# EasyEDA Pro project reference-carrier.epro, board ESP32S3开发板
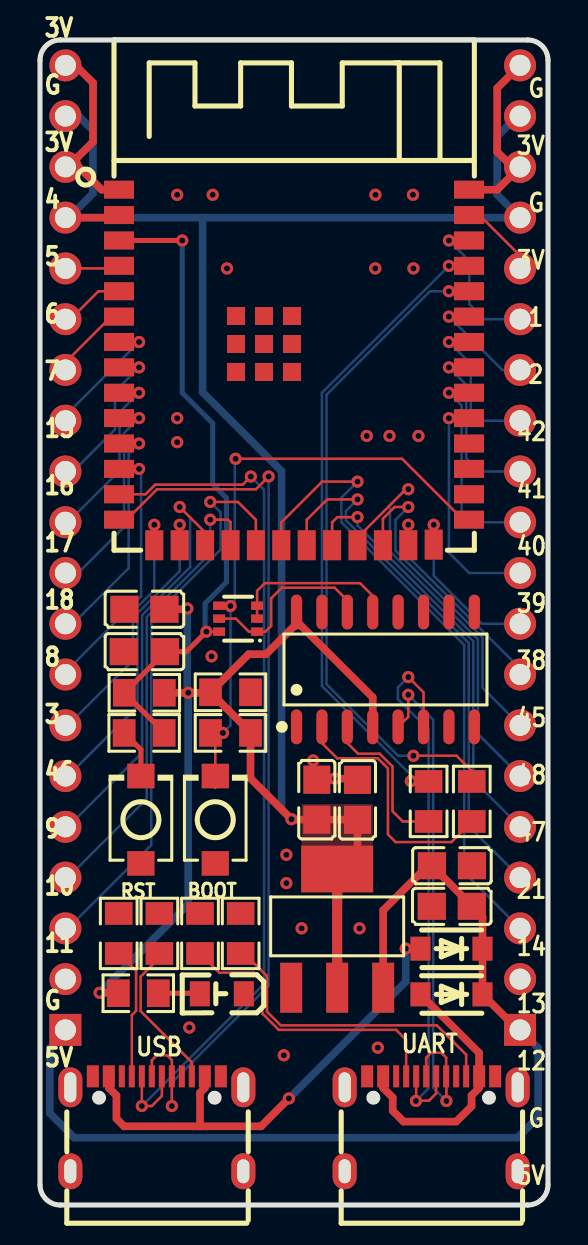
[diagram p2: board, top side]
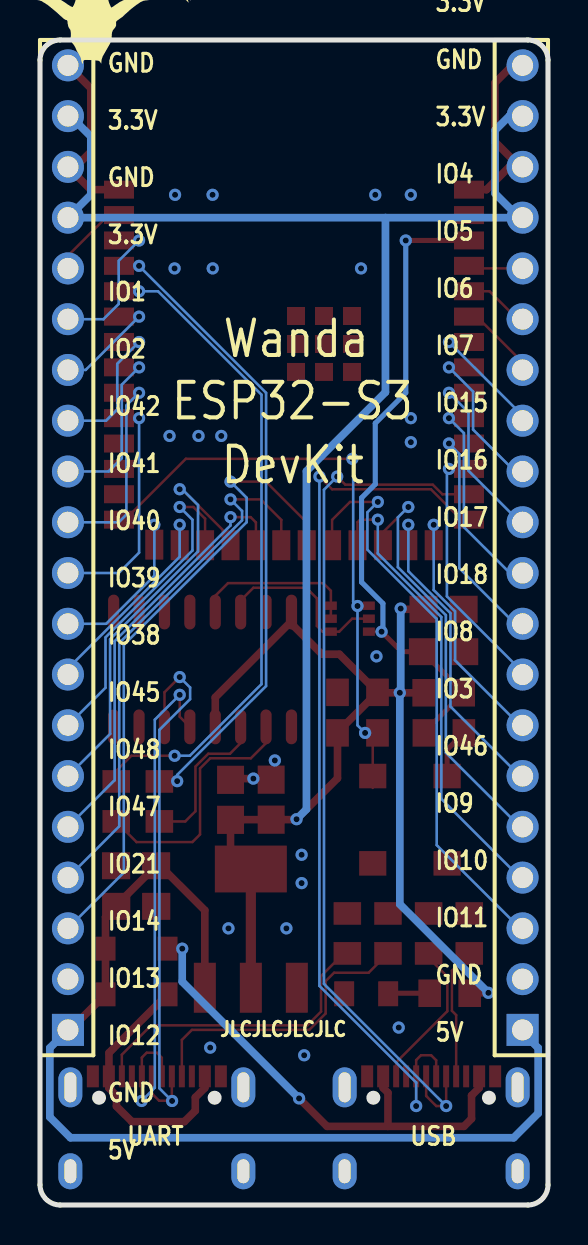
[diagram p3: board, bottom side, seen from below]

Outline 25.4 x 58.29 mm; copper layers: Top Layer, Bottom Layer. Coordinates in mm from the lower left corner of the outline.
Outline path: 0,57.28 0,1.02 arc(0.3,0.3) 1.02,0 24.38,0 arc(25.1,0.3) 25.4,1.02 25.4,57.28 arc(25.1,58) 24.38,58.29 1.02,58.29 arc(0.3,58) 0,57.28
Stack: Top Layer 0.035mm / Dielectric1 1.51mm FR4 er 4.5 / Bottom Layer 0.035mm

## Design rules (mm)
spacing copperThickness1oz (default): track to track 0.102, other pairs 0.152 to 0.3
spacing copperThickness2oz: track to track 0.203, other pairs 0.152 to 0.3
spacing Plane_innerPlane: track to track 0.102, other pairs 0.152 to 0.3
spacing Copper_copperRegion: track to track 0.102, other pairs 0.152 to 0.3
track width copperThickness1oz (default): min 0.127, default 0.254, max 2.54
track width copperThickness2oz: min 0.203, default 0.254, max 2.54
track width 电源: min 0.381, default 0.508, max 2.54
differential pair differentialPair (default): width min 0.127, default 0.254, max 2.54; gap min 0.152, default 0.152
net GND uses 电源
net V3.3 uses 电源
net VBUS uses 电源
pour e481 uses Copper_copperRegion
pour e588 uses Copper_copperRegion

## Placement (name value [footprint] x y rotation side)
BOOT  GT-TC029B-H025-L1N  [SW-SMD_L3.9-W3.0-P4.45]  8.76 19.28 90 top
C1  1uF  [C0805#2]  5.22 27.69 180 top
C3  10uF  [C0805]  20.59 14.94 0 top
C4  100nF  [C0805]  20.6 16.98 180 top
C5  10uF  [C0805]  15.87 20.27 270 top
C6  100nF  [C0805]  13.84 20.28 270 top
C7  100nF  [C0805]  5.22 29.81 180 top
D1  SS14L  [SOD-123F_L2.8-W1.8-LS3.7-RD]  20.57 12.83 180 top
D2  SS14L  [SOD-123F_L2.8-W1.8-LS3.7-RD]  20.57 10.54 180 top
H3  KH-2.54PH180-1X20P-L11.5  [HDR-TH_20P-P2.54-V-M]  1.27 32.89 90 bottom
H4  KH-2.54PH180-1X20P-L11.5  [HDR-TH_20P-P2.54-V-M]  24 32.89 90 bottom
LED1  NCD0805R1  [LED0805-RD_RED]  9.09 10.57 180 top
Q1  UMH3N  [SC-70-6_L2.2-W1.3-P0.65-LS2.1-BR]  9.91 29.34 0 top
R1  5.1kΩ  [R0805]  5.97 13.59 90 top
R2  10K  [R0805]  5.22 25.63 180 top
R3  10K  [R0805]  9.53 23.62 0 top
R5  200Ω  [R0805]  5.21 23.62 0 top
R6  5.1kΩ  [R0805]  3.94 13.59 90 top
R18  10K  [R0805]  9.53 25.65 180 top
R19  5.1kΩ  [R0805]  10.03 13.59 90 top
R20  5.1kΩ  [R0805]  8 13.59 90 top
R21  1kΩ  [R0805]  4.91 10.6 0 top
R22  200Ω  [R0805]  21.59 20.19 90 top
R23  200Ω  [R0805]  19.43 20.19 90 top
RST  GT-TC029B-H025-L1N  [SW-SMD_L3.9-W3.0-P4.45]  5.04 19.28 90 top
U1  ESP32-S3-WROOM-1-N16R8  [WIRELM-SMD_ESP32-S3-WROOM-1]  12.7 41.91 0 top
U3  AMS1117-3.3  [SOT-223-3_L6.5-W3.4-P2.30-LS7.0-BR]  14.86 13.84 270 top
U4  CH340C  [SOP-16_L10.0-W3.9-P1.27-LS6.0-BL]  17.27 26.8 0 top
USB1  TYPE-C 16PIN 2MD(073)  [USB-C-SMD_TYPE-C-6PIN-2MD-073]  5.84 4.06 0 top
USB2  TYPE-C 16PIN 2MD(073)  [USB-C-SMD_TYPE-C-6PIN-2MD-073]  19.56 4.06 0 top

## Footprints (pads in the part's own frame, mm; a bottom-side part is the same pattern mirrored in y, then rotated)
C0805
  rect 1.41x1.35 smd: 1(-1,0) 2(1,0)
C0805#2
  rect 1.41x1.35 smd: 1(-1.03,0) 2(1.03,0)
HDR-TH_20P-P2.54-V-M
  rect 1.6x1.6 hole 1.05: 1(-24.13,0)
  round 1.6 hole 1.05: 2(-21.59,0) 3(-19.05,0) 4(-16.51,0) 5(-13.97,0) 6(-11.43,0) 7(-8.89,0) 8(-6.35,0) 9(-3.81,0) 10(-1.27,0) 11(1.27,0) 12(3.81,0) 13(6.35,0) 14(8.89,0) 15(11.43,0) 16(13.97,0) 17(16.51,0) 18(19.05,0) 19(21.59,0) 20(24.13,0)
LED0805-RD_RED
  rect 1x1.25 smd: 1(-1.1,0) 2(1.1,0)
R0805
  rect 1.133x1.377 smd: 1(-1,0) 2(1,0)
SC-70-6_L2.2-W1.3-P0.65-LS2.1-BR
  rect 0.6x0.42 smd: 1(0.95,-0.65) 2(0.95,0) 3(0.95,0.65) 4(-0.95,0.65) 5(-0.95,0) 6(-0.95,-0.65)
SOD-123F_L2.8-W1.8-LS3.7-RD
  rect 1x1.2 smd: 1(-1.55,0) 2(1.55,0)
SOP-16_L10.0-W3.9-P1.27-LS6.0-BL
  oval 0.56x1.745 smd: 1(-4.445,-2.873) 2(-3.175,-2.873) 3(-1.905,-2.873) 4(-0.635,-2.873) 5(0.635,-2.873) 6(1.905,-2.873) 7(3.175,-2.873) 8(4.445,-2.873) 9(4.445,2.873) 10(3.175,2.873) 11(1.905,2.873) 12(0.635,2.873) 13(-0.635,2.873) 14(-1.905,2.873) 15(-3.175,2.873) 16(-4.445,2.873)
SOT-223-3_L6.5-W3.4-P2.30-LS7.0-BR
  rect 2.5x1.1 smd: 1(2.97,-2.3) 2(2.97,0) 3(2.97,2.3)
  rect 2.34x3.6 smd: 4(-2.97,0)
SW-SMD_L3.9-W3.0-P4.45
  rect 1.23x1.36 smd: 1(-2.185,0) 2(2.185,0)
USB-C-SMD_TYPE-C-6PIN-2MD-073
  rect 0.6x1.1 smd: 1(-3.2,2.375) 2(-2.4,2.375) 11(2.4,2.375) 12(3.2,2.375)
  rect 0.3x1.1 smd: 3(-1.75,2.375) 4(-1.25,2.375) 5(-0.75,2.375) 6(-0.25,2.375) 7(0.25,2.375) 8(0.75,2.375) 9(1.25,2.375) 10(1.75,2.375)
  oval 1.2x2 hole 0.6x1.5: 13(-4.325,1.825) 14(4.325,1.825)
  oval 1.2x1.8 hole 0.6x1.2: 13(-4.325,-2.375) 14(4.325,-2.375)
WIRELM-SMD_ESP32-S3-WROOM-1
  rect 1.5x0.9 smd: 1(-8.75,8.895) 2(-8.75,7.625) 3(-8.75,6.355) 4(-8.75,5.085) 5(-8.75,3.815) 6(-8.75,2.545) 7(-8.75,1.275) 8(-8.75,0.005) 9(-8.75,-1.265) 10(-8.75,-2.535) 11(-8.75,-3.805) 12(-8.75,-5.075) 13(-8.75,-6.345) 14(-8.75,-7.615) 27(8.75,-7.615) 28(8.75,-6.345) 29(8.75,-5.075) 30(8.75,-3.805) 31(8.75,-2.535) 32(8.75,-1.265) 33(8.75,0.005) 34(8.75,1.275) 35(8.75,2.545) 36(8.75,3.815) 37(8.75,5.085) 38(8.75,6.355) 39(8.75,7.625) 40(8.75,8.895)
  rect 0.9x1.5 smd: 15(-6.985,-8.895) 16(-5.715,-8.895) 17(-4.445,-8.895) 18(-3.175,-8.895) 19(-1.905,-8.895) 20(-0.635,-8.895) 21(0.635,-8.895) 22(1.905,-8.895) 23(3.175,-8.895) 24(4.445,-8.895) 25(5.715,-8.895) 26(6.985,-8.865)
  rect 0.9x0.9 smd: 41(-2.9,2.575) 41(-2.9,1.175) 41(-2.9,-0.225) 41(-1.5,2.575) 41(-1.5,1.175) 41(-1.5,-0.225) 41(-0.1,2.575) 41(-0.1,1.175) 41(-0.1,-0.225)

## Nets
As in the schematic, except:
GND: BOOT.1 C1.2 C3.1 C4.1 C5.1 C6.1 C7.2 H3.2 H3.18 H3.20 H4.2 H4.18 H4.20 LED1.1 R1.2 R6.2 R18.1 R19.2 R20.2 RST.1 U1.1 U1.40 U1.41 U3.1 U4.1 USB1.1 USB1.12 USB1.13 USB1.14 USB2.1 USB2.12 USB2.13 USB2.14
IO0: BOOT.2 Q1.4 R3.1 U1.27
$1N3591: R5.1 RST.2

Pads without a net: U1 28 29 30; U4 7 8 9 10 11 12 15; USB1 3 9; USB2 3 9

## Via types
v1: diameter 0.61, hole 0.305, Top Layer to Bottom Layer, 69 vias

## Routing (per net, layer and track width the routed paths; a pad name or vN(x,y) marks a point on that pad's centre or on a via; arc(x,y) is an arc through that point)
GND: length 20.8
  Top Layer w0.381: C6.1 14.68,21.28 v1(14.73,21.34) 15.81,21.34 C5.1 ; 1.4,57.02 1.78,57.02 2.65,56.15 2.65,53.2 1.4,51.94 1.94,51.94 3.08,50.8 U1.1 ; U1.40 22.86,50.8 H4.18 ; 24.04,51.95 23.61,51.95 22.86,52.7 22.86,55.88 H4.20
  vias: v1(6.86,50.55) v1(6.86,39.37) v1(6.86,38.17) v1(7.46,8.88) v1(8.64,50.55) v1(8.58,27.45) v1(9.35,46.86) v1(12.19,7.49) v1(12.32,17.53) v1(12.32,16.11) v1(13.08,13.84) v1(13.66,22.25) v1(15.98,13.84) v1(16.34,38.48) v1(16.77,50.55) v1(16.76,46.86) v1(16.89,7.87) v1(17.47,38.48) v1(18.65,50.55) v1(18.67,46.86) v1(18.92,38.48)
V3.3: length 128.3
  Top Layer w0.381: U3.4 15.87,17.83 C5.2 15.87,19.28 C6.2 12.72,19.28 12.7,19.3 v1(12.57,19.3) 10.53,21.35 R3.2 10.53,23.65 R18.2 10.43,27.56 11.3,27.56 12.83,29.08 12.83,29.21 ; 8.5,25.63 v1(7.41,25.63) R2.1 ; U1.2 3.82,49.4 1.4,49.4 ; C7.1 7.33,29.81 v1(7.37,29.85) ; U4.4 16.64,25.4 12.83,29.21 ; U4.16 12.83,29.21 ; v1(2.98,10.62) 3.63,10.62 3.67,10.57
  Top Layer w0.508: U3.2 U3.4
  Bottom Layer w0.381: v1(7.37,29.85) 7.37,25.67 v1(7.41,25.63) 7.41,15.05 2.98,10.62 v1(2.98,10.62) ; 1.4,54.48 1.94,54.48 2.65,53.77 2.65,50.61 1.46,49.43 1.46,49.4 ; v1(12.57,19.3) 12.08,19.8 12.08,36.72 8.13,40.67 8.13,49.4 ; H4.19 23.88,54.48 22.86,53.47 22.86,50.55 H4.17 8.13,49.4 ; 1.46,49.4 1.4,49.4 ; 1.46,49.4 8.13,49.4 ; 1.46,49.4 1.43,49.38
VBUS: length 52
  Top Layer w0.381: U3.3 17.16,14.75 19.39,16.98 C4.2 21.59,14.98 C3.2 22.12,14.41 D1.1 D2.1 23.9,8.76 H4.1
  Bottom Layer w0.381: 1.4,8.76 0.49,7.86 0.49,4.59 1.71,3.37 23.88,3.37 24.91,4.4 24.91,7.86 H4.1
D+: length 27.2
  Top Layer w0.127: USB2.6 19.31,7.37 19.56,7.62 20.07,7.62 20.31,7.38 USB2.8 20.32,6.43 v1(20.32,5.21) ; 17.91,23.92 18.41,24.43 v1(18.41,25.53)
  Bottom Layer w0.127: v1(20.32,5.21) 19.66,5.87 19.66,24.28 v1(18.41,25.53)
D-: length 28.4
  Top Layer w0.127: 18.81,5.19 18.83,5.22 19.44,5.22 19.81,5.58 USB2.7 ; 18.81,5.19 v1(18.8,5.21) ; 18.81,5.19 USB2.5 ; v1(18.41,26.42) 19.18,25.65 U4.6
  Bottom Layer w0.127: v1(18.8,5.21) 19.43,5.84 19.43,23.78 17.89,25.31 17.89,25.9 v1(18.41,26.42)
DTR: length 8.4
  Top Layer w0.127: U4.13 16.64,30.48 16,31.12 11.24,31.12 10.86,30.73 Q1.3 Q1.2
EN: length 33
  Top Layer w0.127: Q1.6 v1(8.32,28.69)
  Top Layer w0.254: R5.2 6.21,23.64 R2.2 6.25,27.66 C1.1 7.32,27.69 v1(8.32,28.69) ; 3.95,48.26 v1(7.11,48.26)
  Bottom Layer w0.254: v1(8.32,28.69) 8.25,28.75 8.25,30.1 9.32,31.17 9.32,35.38 8.64,36.07 8.64,39.12 7.11,40.64 v1(7.11,48.26)
IO0: length 30.3
  Top Layer w0.127: v1(9.53,29.97) 9.51,29.99 Q1.4 ; v1(9.78,37.34) 18.1,37.34 21.15,34.29 U1.27 ; R3.1 8.76,23.38 8.76,20.87
  Bottom Layer w0.127: v1(9.15,23.62) 9.53,24 v1(9.53,29.97) 9.74,30.19 9.74,37.3 v1(9.78,37.34)
IO1: length 4
  Top Layer w0.127: H4.16 24,47.5 21.97,49.53 U1.39
IO2: length 7.5
  Top Layer w0.127: 21.45,48.26 v1(20.45,48.26)
  Bottom Layer w0.127: v1(20.45,48.26) 21.46,47.24 21.46,45.09 22.22,44.32 H4.15
IO3: length 12.8
  Top Layer w0.127: 5.72,33.01 v1(5.72,34.04)
  Bottom Layer w0.127: v1(5.72,34.04) 5.72,30.77 4.65,29.71 4.65,27.25 1.4,24
IO4: length 2.6
  Top Layer w0.127: U1.4 3.82,46.86 1.4,46.86
IO5: length 3.1
  Top Layer w0.127: 3.95,45.72 2.92,45.72 1.52,44.32 1.4,44.32
IO6: length 4
  Top Layer w0.127: 1.4,41.78 1.37,41.81 1.37,42.27 3.43,44.32 3.82,44.32 U1.6
IO7: length 6.4
  Top Layer w0.127: 3.95,43.18 v1(4.95,43.18)
  Bottom Layer w0.127: 1.4,39.24 1.52,39.37 1.52,39.75 v1(4.95,43.18)
IO8: length 12.8
  Top Layer w0.127: U1.12 4.95,36.83
  Bottom Layer w0.127: 1.4,26.54 1.4,26.8 5.05,30.45 5.05,36.73 v1(4.95,36.83)
IO9: length 21.2
  Top Layer w0.127: v1(6.99,34.93) 8.25,33.66 U1.17
  Bottom Layer w0.127: v1(6.99,34.93) 7.51,34.4 7.51,31.92 5.11,29.52 5.11,22.63 1.4,18.92
IO10: length 23.1
  Top Layer w0.127: v1(8.51,34.29) 9.4,34.29 9.53,34.16 U1.18
  Bottom Layer w0.127: 1.4,16.38 5.34,20.32 5.34,29.42 8.51,32.6 v1(8.51,34.29)
IO11: length 28.6
  Top Layer w0.127: U1.19 10.79,34.28 9.9,35.18 v1(8.51,35.18)
  Bottom Layer w0.127: v1(8.51,35.18) 9.03,34.66 9.03,32.79 5.56,29.33 5.56,18.01 1.4,13.84
IO12: length 32.2
  Top Layer w0.127: v1(15.88,36.2) 14.1,36.2 12.06,34.16 U1.20
  Bottom Layer w0.127: H4.3 21.21,16.64 21.21,28.02 15.07,34.16 15.07,35.39 v1(15.88,36.2)
IO13: length 27
  Top Layer w0.127: v1(15.88,35.31) 14.36,35.31 13.34,34.28 13.34,33.01
  Bottom Layer w0.127: v1(15.88,35.31) 15.3,34.73 15.3,34.26 21.44,28.12 21.44,18.95 H4.4
IO14: length 21.4
  Top Layer w0.127: v1(15.88,34.42) 14.87,34.42 14.6,34.16 U1.22
  Bottom Layer w0.127: H4.5 21.67,21.26 21.67,28.21 15.88,34 v1(15.88,34.42)
IO15: length 7.8
  Top Layer w0.127: U1.8 4.95,41.91
  Bottom Layer w0.127: 1.4,36.7 1.65,36.7 3.75,38.8 3.75,40.7 v1(4.95,41.91)
IO16: length 9
  Top Layer w0.127: U1.9 v1(4.95,40.64)
  Bottom Layer w0.127: v1(4.95,40.64) 3.97,39.66 3.97,36.74 1.4,34.16
IO17: length 10.5
  Top Layer w0.127: U1.10 v1(4.95,39.37)
  Bottom Layer w0.127: 1.4,31.62 1.91,31.62 4.2,33.92 4.2,38.62 v1(4.95,39.37)
IO18: length 11.6
  Top Layer w0.127: U1.11 v1(4.95,38.1)
  Bottom Layer w0.127: v1(4.95,38.1) 4.43,37.58 4.43,31.86 1.65,29.08 1.4,29.08
IO19: length 44.9
  Top Layer w0.127: U1.13 5.28,35.56 5.76,36.04 10.13,36.04 v1(10.54,36.45) ; USB1.7 6.09,5.46 5.59,4.95 v1(5.09,4.95) USB1.5
  Bottom Layer w0.127: v1(5.09,4.95) 11.2,11.06 11.2,35.79 v1(10.54,36.45)
IO20: length 46.2
  Top Layer w0.127: U1.14 4.33,34.29 5.85,35.81 10.79,35.81 v1(11.43,36.45) ; v1(6.59,4.95) USB1.8 6.59,7.25 6.35,7.49 5.84,7.49 5.59,7.24 USB1.6
  Bottom Layer w0.127: v1(11.43,36.45) 11.43,10.97 6.59,6.13 v1(6.59,4.95)
IO21: length 21.4
  Top Layer w0.127: U1.23 15.88,33.39 18.3,35.81 v1(18.41,35.81)
  Bottom Layer w0.127: H4.6 21.9,23.57 21.9,28.31 17.5,32.7 17.5,35.02 18.29,35.81 v1(18.41,35.81)
IO38: length 11.7
  Top Layer w0.127: 21.45,39.37 v1(20.45,39.37)
  Bottom Layer w0.127: v1(20.45,39.37) 20.45,32.64 21.46,31.62 H4.10
IO39: length 10.4
  Top Layer w0.127: 21.45,40.64 v1(20.45,40.64)
  Bottom Layer w0.127: v1(20.45,40.64) 21.08,40.01 21.08,34.54 21.46,34.16 H4.11
IO40: length 8.9
  Top Layer w0.127: 21.45,41.91 v1(20.45,41.91)
  Bottom Layer w0.127: v1(20.45,41.91) 21.31,41.05 21.31,37.36 21.97,36.7 H4.12
IO41: length 7.5
  Top Layer w0.127: 21.45,43.18 v1(20.45,43.18)
  Bottom Layer w0.127: H4.13 22.1,39.24 21.54,39.8 21.54,42.09 v1(20.45,43.18)
IO42: length 5.7
  Top Layer w0.127: 21.45,44.45 v1(20.45,44.45)
  Bottom Layer w0.127: H4.14 23.11,41.78 v1(20.45,44.45)
IO45: length 8.9
  Top Layer w0.127: 19.69,33.04 v1(19.69,34.04)
  Bottom Layer w0.127: H4.9 22.09,29.08 19.69,31.49 v1(19.69,34.04)
IO46: length 15.9
  Top Layer w0.127: U1.16 v1(6.99,34.04)
  Bottom Layer w0.127: v1(6.99,34.04) 6.99,31.72 4.88,29.61 4.88,24.94 1.4,21.46
IO47: length 16.6
  Top Layer w0.127: U1.24 17.15,34.34 17.73,34.93 v1(18.41,34.93)
  Bottom Layer w0.127: v1(18.41,34.93) 17.78,34.29 17.78,32.75 22.12,28.4 22.12,25.88 H4.7
IO48: length 10.8
  Top Layer w0.127: U1.25 v1(18.41,34.04)
  Bottom Layer w0.127: v1(18.41,34.04) 18.41,32.43 24,26.85 H4.8
RTS: length 9.2
  Top Layer w0.127: Q1.5 9.79,29.34 10.44,28.69 Q1.1 11.27,28.69 11.56,28.97 11.56,30.35 12.09,30.89 14.73,30.89 15.37,30.25 U4.14
RXD: length 33.3
  Top Layer w0.127: v1(18.67,22.48) 20.83,22.48 21.59,21.72 R22.2 ; 21.45,45.72 v1(20.45,45.72)
  Bottom Layer w0.127: v1(20.45,45.72) 19.5,45.72 14.33,40.55 14.33,26.06 17.91,22.48 v1(18.67,22.48)
TXD: length 32.1
  Top Layer w0.127: 21.45,46.99 v1(20.45,46.99) ; R23.2 19.41,21.21 v1(18.54,21.21)
  Bottom Layer w0.127: v1(18.54,21.21) 18.54,21.52 14.1,25.97 14.1,40.64 v1(20.45,46.99)
$1N977: length 7.6
  Top Layer w0.127: USB1.10 7.59,7.14 5.03,9.7 5.03,11.43 5.97,12.37 R1.1
$1N978: length 6.6
  Top Layer w0.127: R6.1 4.81,11.72 4.81,9.72 4.59,9.5 USB1.4
$1N984: length 24.9
  Top Layer w0.381: 8,3.94 11.05,3.94 v1(12.45,5.33) ; 8,3.94 4.2,3.94 3.82,4.32 3.82,5.48 3.44,5.86 USB1.2 ; 8,3.94 8,5.62 8.24,5.86 USB1.11 ; v1(18.29,12.83) D1.2
  Bottom Layer w0.381: v1(18.29,12.83) 18.29,11.18 v1(12.45,5.33)
$1N3135: length 15.5
  Top Layer w0.127: USB2.10 21.31,7.52 19.84,8.99 12.03,8.99 11.35,9.68 11.35,11.45 10.21,12.59 R19.1
$1N3136: length 14.9
  Top Layer w0.127: USB2.4 18.31,8.26 17.81,8.76 11.94,8.76 11.12,9.58 11.12,11.2 10.7,11.62 8.97,11.62 R20.1
$1N3142: length 13.3
  Top Layer w0.381: D2.2 21.95,7.61 21.95,6.52 ; USB2.11 21.96,5.86 21.58,5.48 21.58,4.94 20.81,4.17 18.18,4.17 17.63,4.72 17.63,5.38 17.16,5.86 USB2.2
$1N3591: length 2.5
  Top Layer w0.254: RST.2 5.04,22.78 R5.1
$1N8419: length 2
  Top Layer w0.254: R21.2 7.88,10.6 7.88,10.59
$1N10176: length 12.7
  Top Layer w0.127: R22.1 21.59,19.18 20.57,18.16 17.78,18.16 17.4,18.54 17.4,21.84 16.89,22.35 14.86,22.35 14.1,23.11 U4.2
$1N10216: length 7.8
  Top Layer w0.127: U4.3 15.37,23.11 15.9,22.58 16.99,22.58 17.63,21.94 17.63,19.7 18.14,19.19 R23.1

## Copper pours and planes (outline as drawn; the poured copper is in the pictures)
GND on Top Layer: -5.97,62.87 29.72,62.87 29.72,-2.67 -5.97,-2.67
GND on Bottom Layer: -2.67,59.94 33.53,59.94 33.53,-5.59 -2.67,-5.59
V3.3 on Top Layer: 13.08,20.07 16.64,20.07 16.64,17.91 13.08,17.91

## Text on the board
Bottom Silkscreen Layer: JLCJLCJLCJLC | GND / 3.3V / GND / 3.3V / IO1 / IO2 / IO42 / IO41 / IO40 / IO39 / IO38 / IO45 / IO48 / IO47 / IO21 / IO14 / IO13 / IO12 / GND / 5V | GND / 3.3V / GND / 3.3V / IO4 / IO5 / IO6 / IO7 / IO15 / IO16 / IO17 / IO18 / IO8 / IO3 / IO46 / IO9 / IO10 / IO11 / GND / 5V | USB | UART | Wanda | DevKit | ESP32-S3
Top Silkscreen Layer: G / 3V / G / 3V / 1 / 2 / 42 / 41 / 40 / 39 / 38 / 45 / 48 / 47 / 21 / 14 / 13 / 12 / G / 5V | USB | UART | G / 3V / G / 3V / 4 / 5 / 6 / 7 / 15 / 16 / 17 / 18 / 8 / 3 / 46 / 9 / 10 / 11 / G / 5V
